# Altium schematic sheet Laser_Driver.SchDoc
size A4; Date: *******; ApprovedBy: *******; CheckedBy: None; Author: *******; CompanyName: *******; DrawnBy: Name; Engineer: *******; Organization: *******; Address1: *******; Address2: *******; Address3: *******; Address4: *******; DocumentNumber: Doc Num; Revision: *******; SheetNumber: 5; SheetTotal: 7; CurrentTime: *******; CurrentDate: *******; Time: *******; DocumentFullPathAndName: *******; DocumentName: *******; ModifiedDate: *******; ImagePath: *******; ProjectName: *******; Application_BuildNumber: *******
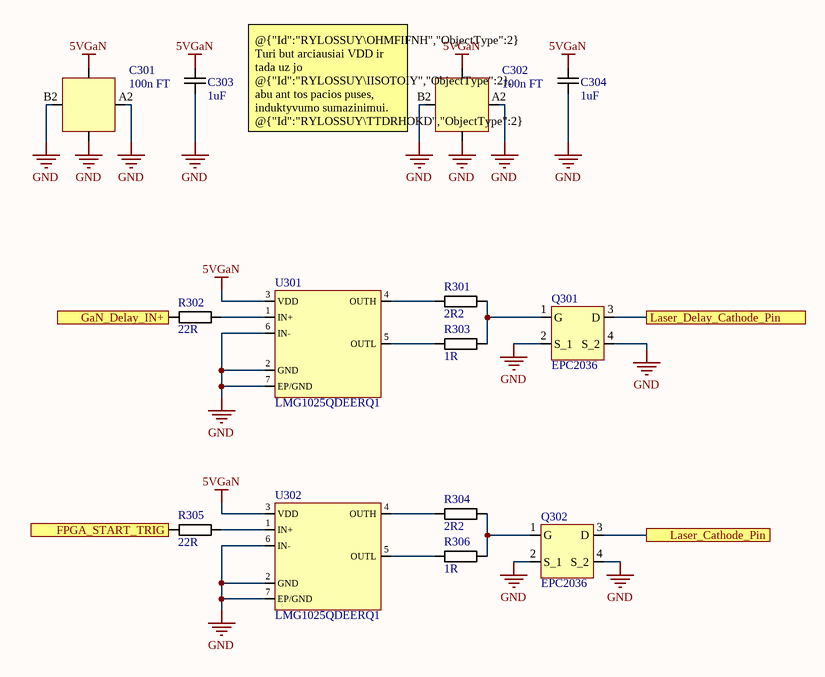
[diagram p0: Laser_Driver.SchDoc]

## Parts
C301  100n FT  [100n FT 0603]
C302  100n FT  [100n FT 0603]
C303  1uF  [1uF 0603]
C304  1uF  [1uF 0603]
Q301  EPC2036  [EPC2036]
Q302  EPC2036  [EPC2036]
R301  2R2  [2R2 0402]
R302  22R  [22R 0402]
R303  1R  [1R 0402]
R304  2R2  [2R2 0402]
R305  22R  [22R 0402]
R306  1R  [1R 0402]
U301  LMG1025QDEERQ1  [LMG1025QDEERQ1]
U302  LMG1025QDEERQ1  [LMG1025QDEERQ1]

## Ports
FPGA_START_TRIG (see Inputs_Outputs[3C]), GaN_Delay_IN+ (see Time_Delay[4B]), Laser_Cathode_Pin (see Laser_System[1C]), Laser_Delay_Cathode_Pin (see Laser_System[1B])

## Nets
5VGaN: C301.3(OUTPUT) C302.3(OUTPUT) C303.2 C304.2 U301.3(VDD) U302.3(VDD)
GND: C301.1(INPUT) C301.A2(GND_1) C301.B2(GND_2) C302.1(INPUT) C302.A2(GND_1) C302.B2(GND_2) C303.1 C304.1 Q301.2(S_1) Q301.4(S_2) Q302.2(S_1) Q302.4(S_2) U301.2(GND) U301.6(IN-) U301.7(EP/GND) U302.2(GND) U302.6(IN-) U302.7(EP/GND)
FPGA_START_TRIG: R305.2 ; port FPGA_START_TRIG
GaN_Delay_IN+: R302.2 ; port GaN_Delay_IN+
Laser_Cathode_Pin: Q302.3(D) ; port Laser_Cathode_Pin
Laser_Delay_Cathode_Pin: Q301.3(D) ; port Laser_Delay_Cathode_Pin
NetQ301_1: Q301.1(G) R301.2 R303.2
NetQ302_1: Q302.1(G) R304.2 R306.2
NetR301_1: R301.1 U301.4(OUTH)
NetR302_1: R302.1 U301.1(IN+)
NetR303_1: R303.1 U301.5(OUTL)
NetR304_1: R304.1 U302.4(OUTH)
NetR305_1: R305.1 U302.1(IN+)
NetR306_1: R306.1 U302.5(OUTL)

## Notes on the sheet
- (near C302) @{"Id":"RYLOSSUY\OHMFIFNH","ObjectType":2} Turi but arciausiai VDD ir tada uz jo @{"Id":"RYLOSSUY\IISOTOIY","ObjectType":2}, abu ant tos pacios puses, induktyvumo sumazinimui.
  @{"Id":"RYLOSSUY\TTDRHOKD","ObjectType":2} Slopina visokius nepageidaujemus signalus
- Title:
- Date:
- Author:
- Sheet:
- Of
- File:

## Library data of the parts
C301 C302 = 100n 0603 FT: NFM18PC104R1C3D
C303 C304 = 1uF 0603: CGA3E1X7R1E105K080AC
R301 R304 = 2R2 0402: CRT0402-FZ-2R00GLF
R302 R305 = 22R 0402: ERA-2AKD220X
R303 R306 = 1R 0402: CRT0402-FZ-1R00GLF
U301 U302 = LMG1025QDEERQ1: GaN Driver